# Altium project Firefly-Ultra.PrjPcb (part 2 of 2)

## Sheet ffultra_p2_channel.SchDoc
size A4; SheetNumber: 12; SheetTotal: 13
Used 2 times, as channels Pyro/CH1, Pyro/CH2. Parts and nets are listed once, with the designators drawn on the sheet.
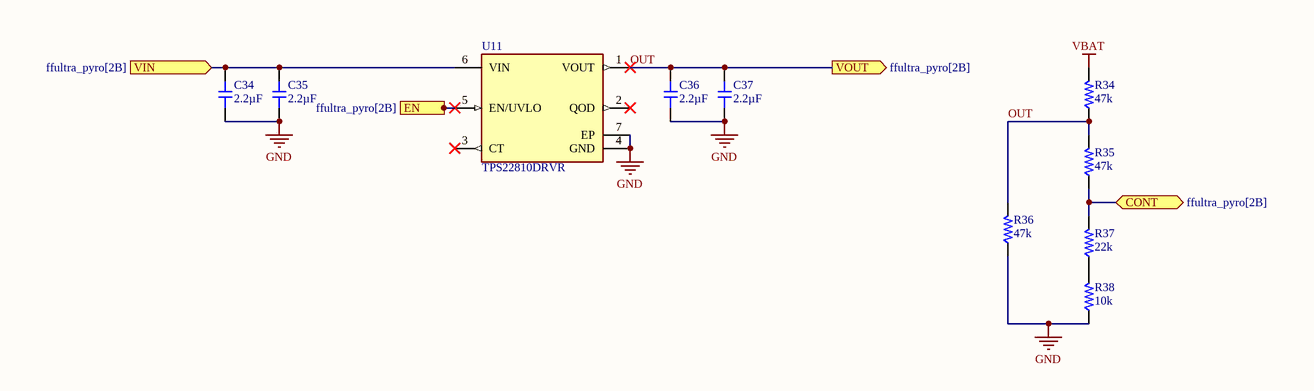
[diagram p10: ffultra_p2_channel.SchDoc]

### Parts
C34  value 2.2µF  [CAP-0402]  (hidden comment: CL05A225MQ5NSNC)
C35  value 2.2µF  [CAP-0402]  (hidden comment: CL05A225MQ5NSNC)
C36  value 2.2µF  [CAP-0402]  (hidden comment: CL05A105KA5NQNC)
C37  value 2.2µF  [CAP-0402]  (hidden comment: CL05A105KA5NQNC)
R34  value 47k  [RES-0402]  (hidden comment: 0402WGF4702TCE)
R35  value 47k  [RES-0402]  (hidden comment: 0402WGF4702TCE)
R36  value 47k  [RES-0402]  (hidden comment: 0402WGF4702TCE)
R37  value 22k  [RES-0402]  (hidden comment: 0402WGF2202TCE)
R38  value 10k  [RES-0402]  (hidden comment: 0402WGF1002TCE)
U11  TPS22810DRVR  [FP-DRV0006A-IPC_A]

### Ports
CONT (bidir, see ffultra_pyro[2B]), EN (in, see ffultra_pyro[2B]), VIN (in, see ffultra_pyro[2B]), VOUT (out, see ffultra_pyro[2B])

### Nets
GND: C34.1 C35.1 C36.1 C37.1 R36.1 R38.1 U11.4(GND) U11.7(EP)
VBAT: R34.2
CONT: R35.1 R37.2 ; port CONT
EN: U11.5(EN/UVLO) ; port EN
OUT: C36.2 C37.2 R34.1 R35.2 R36.2 U11.1(VOUT) ; port VOUT
VIN: C34.2 C35.2 U11.6(VIN) ; port VIN
NetR37_1: R37.1 R38.2

Not connected (* = marked no-connect by the designer): U11 2(QOD)* 3(CT)*

### Channels
Pyro/CH1: designators end in _CH1; ports CONT=CONT_CH1 EN=EN_CH1 VIN=Prechannel_Enabled VOUT=OUT
Pyro/CH2: designators end in _CH2; ports CONT=CONT_CH2 EN=EN_CH2 VIN=Prechannel_Enabled VOUT=OUT

### Library data of the parts
C34 C35 = CMP-001-00137-1: Capacitor, Ceramic (MLCC), 2.2uF, ±20%, 6.3V, X5R, ±20%, SMD 0402; Manufacturer: Samsung Electro-Mechanics; Voltage Rating: 6.3V; ComponentLink3Description: LCSC Part URL; JLCPCB Basic Part: Yes; JLCPCB Part Number: C12530; ComponentLink1URL: https://datasheet.lcsc.com/lcsc/1811021410_Samsung-Electro-Mechanics-CL05A225MQ5NSNC_C12530.pdf; Tolerance: 20%; Category: Capacitors - MLCC; Source: jlcpcb_capacitors_basic.schlib; ComponentLink2URL: https://jlcpcb.com/partdetail/C12530; ComponentLink3URL: https://lcsc.com/product-detail/Multilayer-Ceramic-Capacitors-MLCC---SMD-SMT_Samsung-Electro-Mechanics-Samsung-Electro-Mechanics-CL05A225MQ5NSNC_C12530.html; ComponentLink2Description: JLCPCB Part URL; Manufacturer Part Number: CL05A225MQ5NSNC; Temperature Coefficient: X5R; RoHS: Yes; ComponentLink1Description: Datasheet; Design Item ID: CL05A225MQ5NSNC; Case/Package: 0402
C36 C37 = CMP-001-00135-1: Capacitor, Ceramic (MLCC), 1uF, ±10%, 25V, X5R, ±10%, SMD 0402; Manufacturer: Samsung Electro-Mechanics; Voltage Rating: 25V; RoHS: Yes; Temperature Coefficient: X5R; Tolerance: 10%; Source: jlcpcb_capacitors_basic.schlib; ComponentLink1URL: https://datasheet.lcsc.com/lcsc/1811091611_Samsung-Electro-Mechanics-CL05A105KA5NQNC_C52923.pdf; JLCPCB Basic Part: Yes; ComponentLink1Description: Datasheet; ComponentLink2URL: https://jlcpcb.com/partdetail/C52923; Case/Package: 0402; ComponentLink3Description: LCSC Part URL; Manufacturer Part Number: CL05A105KA5NQNC; ComponentLink3URL: https://lcsc.com/product-detail/Multilayer-Ceramic-Capacitors-MLCC---SMD-SMT_Samsung-Electro-Mechanics-Samsung-Electro-Mechanics-CL05A105KA5NQNC_C52923.html; Design Item ID: CL05A105KA5NQNC; JLCPCB Part Number: C12530; ComponentLink2Description: JLCPCB Part URL; Category: Capacitors - MLCC
R34-R36 = CMP-009-00229-1: Resistor, 47kΩ, ±1%, 62.5mW, 50V, ±100ppm/℃, -55℃~+155℃, SMD 0402; Manufacturer: Uniroyal; Voltage Rating: 50V; ComponentLink2URL: https://jlcpcb.com/partdetail/C25792; ComponentLink1Description: Datasheet; Design Item ID: 0402WGF4702TCE; JLCPCB Part Number: C25792; Tolerance: 1%; Power Rating: 62.5mW; Temperature Coefficient: ±100ppm/℃; Temperature Rating: -55℃~+155℃; ComponentLink2Description: JLCPCB Part URL; Source: jlcpcb_resistors_basic.schlib; Case/Package: 0402; ComponentLink1URL: https://datasheet.lcsc.com/lcsc/2206010100_UNI-ROYAL-Uniroyal-Elec-0402WGF4702TCE_C25792.pdf; JLCPCB Basic Part: Yes; Manufacturer Part Number: 0402WGF4702TCE; Category: Resistors
R37 = CMP-009-00212-1: Resistor, 22kΩ, ±1%, 62.5mW, 50V, ±100ppm/℃, -55℃~+155℃, SMD 0402; Manufacturer: Uniroyal; Temperature Coefficient: ±100ppm/℃; Power Rating: 62.5mW; ComponentLink1URL: https://datasheet.lcsc.com/lcsc/2206010100_UNI-ROYAL-Uniroyal-Elec-0402WGF2202TCE_C25768.pdf; ComponentLink1Description: Datasheet; Manufacturer Part Number: 0402WGF2202TCE; Tolerance: 1%; Category: Resistors; Temperature Rating: -55℃~+155℃; Case/Package: 0402; Source: jlcpcb_resistors_basic.schlib; Voltage Rating: 50V; ComponentLink2Description: JLCPCB Part URL; ComponentLink2URL: https://jlcpcb.com/partdetail/C25768; Design Item ID: 0402WGF2202TCE; JLCPCB Basic Part: Yes; JLCPCB Part Number: C25768
R38 = CMP-009-00191-1: Resistor, 10kΩ, ±1%, 62.5mW, 50V, ±100ppm/℃, -55℃~+155℃, SMD 0402; Manufacturer: Uniroyal; Temperature Rating: -55℃~+155℃; ComponentLink1URL: https://datasheet.lcsc.com/lcsc/2206010100_UNI-ROYAL-Uniroyal-Elec-0402WGF1002TCE_C25744.pdf; Source: jlcpcb_resistors_basic.schlib; Tolerance: 1%; Design Item ID: 0402WGF1002TCE; ComponentLink1Description: Datasheet; ComponentLink2URL: https://jlcpcb.com/partdetail/C25744; Category: Resistors; JLCPCB Part Number: C25744; ComponentLink2Description: JLCPCB Part URL; Temperature Coefficient: ±100ppm/℃; JLCPCB Basic Part: Yes; Power Rating: 62.5mW; Case/Package: 0402; Voltage Rating: 50V; Manufacturer Part Number: 0402WGF1002TCE
U11 = CMP-019-00059-2: Buffer/Inverter Based Peripheral Driver, 1 Driver, PDSO6; Min Supply Voltage: 2.7V; Max Supply Voltage: 18V; RoHS Compliant: Yes; Height - Seated (Max): 0.8mm; Max Operating Temperature: 105°C; JLCPCB Part Number: C527679; Min Operating Temperature: -40°C; JESD-30 Code: S-PDSO-N6; Pins: 6; Case/Package: VSON

## Sheet ffultra_p2_pre-channel.SchDoc
size A4; SheetNumber: 11; SheetTotal: 12
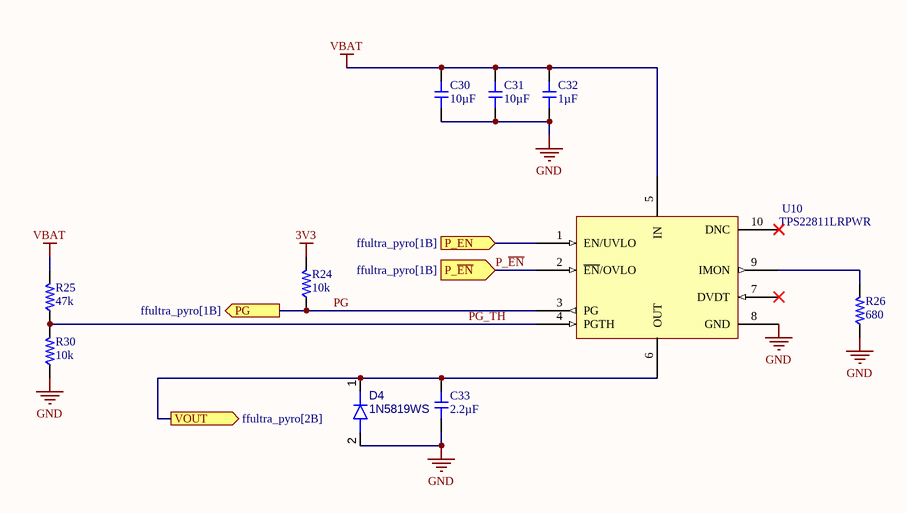
[diagram p11: ffultra_p2_pre-channel.SchDoc]

### Parts
C30  value 10µF  [CAP-0402]  (hidden comment: GRM155R61A106ME44D)
C31  value 10µF  [CAP-0402]  (hidden comment: GRM155R61A106ME44D)
C32  value 1µF  [CAP-0402]  (hidden comment: CL05A105KA5NQNC)
C33  value 2.2µF  [CAP-0402]  (hidden comment: CL05A225MQ5NSNC)
D4  1N5819WS  [FP-477-02-IPC_C]
R24  value 10k  [RES-0402]  (hidden comment: 0402WGF1002TCE)
R25  value 47k  [RES-0402]  (hidden comment: 0402WGF4702TCE)
R26  value 680  [RES-0402]  (hidden comment: 0402WGF6800TCE)
R30  value 10k  [RES-0402]  (hidden comment: 0402WGF1002TCE)
U10  TPS22811LRPWR  [TPS22811LRPWR-Footprint-1]

### Ports
P_EN (in, see ffultra_pyro[1B]), P_~{EN} (in, see ffultra_pyro[1B]), PG (out, see ffultra_pyro[1B]), VOUT (out, see ffultra_pyro[2B])

### Nets
3V3: R24.2
GND: C30.2 C31.2 C32.1 C33.1 D4.2(A) R26.1 R30.1 U10.8(GND)
VBAT: C30.1 C31.1 C32.2 R25.2 U10.5(IN)
MCU_EN: U10.1(EN/UVLO) ; port P_EN
P_~{EN}: U10.2(~{EN}/OVLO) ; port P_~{EN}
PG: R24.1 U10.3(PG) ; port PG
PG_TH: R25.1 R30.2 U10.4(PGTH)
Prechannel_Enabled: C33.2 D4.1(K) U10.6(OUT) ; port VOUT
NetR26_2: R26.2 U10.9(IMON)

Not connected (* = marked no-connect by the designer): U10 7(DVDT)* 10(DNC)*

### Library data of the parts
C30 C31 = CMP-001-01770-1: Capacitor, Ceramic (MLCC), 10uF, ±20%, 10V, X5R, ±20%, SMD 0402; Manufacturer: Murata Electronics; Manufacturer Part Number: GRM155R61A106ME44D; ComponentLink3URL: https://lcsc.com/product-detail/Multilayer-Ceramic-Capacitors-MLCC---SMD-SMT_Murata-Electronics-Murata-Electronics-GRM155R61A106ME44D_C77000.html; Case/Package: 0402; Category: Capacitors - MLCC; Design Item ID: GRM155R61A106ME44D; JLCPCB Part Number: C77000; Source: jlcpcb_capacitors_extended_0402.schlib; ComponentLink2URL: https://jlcpcb.com/partdetail/C77000; Temperature Coefficient: X5R; ComponentLink3Description: LCSC Part URL; Tolerance: 20%; RoHS: Yes; JLCPCB Basic Part: No; ComponentLink2Description: JLCPCB Part URL; Voltage Rating: 10V; ComponentLink1Description: Datasheet; ComponentLink1URL: https://datasheet.lcsc.com/lcsc/1811141510_Murata-Electronics-GRM155R61A106ME44D_C77000.pdf
C32 = CMP-001-00135-1: as C36 on sheet ffultra_p2_channel; Voltage Rating: 25V; RoHS: Yes; Temperature Coefficient: X5R; Tolerance: 10%; Source: jlcpcb_capacitors_basic.schlib; ComponentLink1URL: https://datasheet.lcsc.com/lcsc/1811091611_Samsung-Electro-Mechanics-CL05A105KA5NQNC_C52923.pdf; JLCPCB Basic Part: Yes; ComponentLink1Description: Datasheet; ComponentLink2URL: https://jlcpcb.com/partdetail/C52923; Case/Package: 0402; ComponentLink3Description: LCSC Part URL; Manufacturer Part Number: CL05A105KA5NQNC; ComponentLink3URL: https://lcsc.com/product-detail/Multilayer-Ceramic-Capacitors-MLCC---SMD-SMT_Samsung-Electro-Mechanics-Samsung-Electro-Mechanics-CL05A105KA5NQNC_C52923.html; Design Item ID: CL05A105KA5NQNC; JLCPCB Part Number: C52923; ComponentLink2Description: JLCPCB Part URL; Category: Capacitors - MLCC
C33 = CMP-001-00137-1: as C34 on sheet ffultra_p2_channel; Voltage Rating: 6.3V; ComponentLink3Description: LCSC Part URL; JLCPCB Basic Part: Yes; JLCPCB Part Number: C12530; ComponentLink1URL: https://datasheet.lcsc.com/lcsc/1811021410_Samsung-Electro-Mechanics-CL05A225MQ5NSNC_C12530.pdf; Tolerance: 20%; Category: Capacitors - MLCC; Source: jlcpcb_capacitors_basic.schlib; ComponentLink2URL: https://jlcpcb.com/partdetail/C12530; ComponentLink3URL: https://lcsc.com/product-detail/Multilayer-Ceramic-Capacitors-MLCC---SMD-SMT_Samsung-Electro-Mechanics-Samsung-Electro-Mechanics-CL05A225MQ5NSNC_C12530.html; ComponentLink2Description: JLCPCB Part URL; Manufacturer Part Number: CL05A225MQ5NSNC; Temperature Coefficient: X5R; RoHS: Yes; ComponentLink1Description: Datasheet; Design Item ID: CL05A225MQ5NSNC; Case/Package: 0402
D4 = CMP-004-00036-1: 40V 600mV@1A 1A SOD-323  Schottky Barrier Diodes (SBD) ROHS; JLCPCB Part Number: C191023
R24 R30 = CMP-009-00191-1: as R38 on sheet ffultra_p2_channel; Temperature Rating: -55℃~+155℃; ComponentLink1URL: https://datasheet.lcsc.com/lcsc/2206010100_UNI-ROYAL-Uniroyal-Elec-0402WGF1002TCE_C25744.pdf; Source: jlcpcb_resistors_basic.schlib; Tolerance: 1%; Design Item ID: 0402WGF1002TCE; ComponentLink1Description: Datasheet; ComponentLink2URL: https://jlcpcb.com/partdetail/C25744; Category: Resistors; JLCPCB Part Number: C25744; ComponentLink2Description: JLCPCB Part URL; Temperature Coefficient: ±100ppm/℃; JLCPCB Basic Part: Yes; Power Rating: 62.5mW; Case/Package: 0402; Voltage Rating: 50V; Manufacturer Part Number: 0402WGF1002TCE
R25 = CMP-009-00229-1: as R34 on sheet ffultra_p2_channel; Voltage Rating: 50V; ComponentLink2URL: https://jlcpcb.com/partdetail/C25792; ComponentLink1Description: Datasheet; Design Item ID: 0402WGF4702TCE; JLCPCB Part Number: C25792; Tolerance: 1%; Power Rating: 62.5mW; Temperature Coefficient: ±100ppm/℃; Temperature Rating: -55℃~+155℃; ComponentLink2Description: JLCPCB Part URL; Source: jlcpcb_resistors_basic.schlib; Case/Package: 0402; ComponentLink1URL: https://datasheet.lcsc.com/lcsc/2206010100_UNI-ROYAL-Uniroyal-Elec-0402WGF4702TCE_C25792.pdf; JLCPCB Basic Part: Yes; Manufacturer Part Number: 0402WGF4702TCE; Category: Resistors
R26 = CMP-009-00241-1: Resistor, 680Ω, ±1%, 62.5mW, 50V, ±100ppm/℃, -55℃~+155℃, SMD 0402; Manufacturer: Uniroyal; ComponentLink1Description: Datasheet; ComponentLink1URL: https://datasheet.lcsc.com/lcsc/2205311900_UNI-ROYAL-Uniroyal-Elec-0402WGF6800TCE_C25130.pdf; Temperature Rating: -55℃~+155℃; Category: Resistors; Source: jlcpcb_resistors_basic.schlib; Power Rating: 62.5mW; JLCPCB Part Number: C25130; Voltage Rating: 50V; ComponentLink2Description: JLCPCB Part URL; Tolerance: 1%; Manufacturer Part Number: 0402WGF6800TCE; Temperature Coefficient: ±100ppm/℃; JLCPCB Basic Part: Yes; Case/Package: 0402; Design Item ID: 0402WGF6800TCE; ComponentLink2URL: https://jlcpcb.com/partdetail/C25130
U10 = CMP-019-00060-6: 2.7-V to 16-V, 10-A, 6-mΩ load switch with fast overvoltage protection and current monitoring 10-VQFN-HR -40 to 125; JLCPCB Part Number: C17294173

## Sheet ffultra_human-interfaces.SchDoc
size A4; SheetNumber: 13; SheetTotal: 13
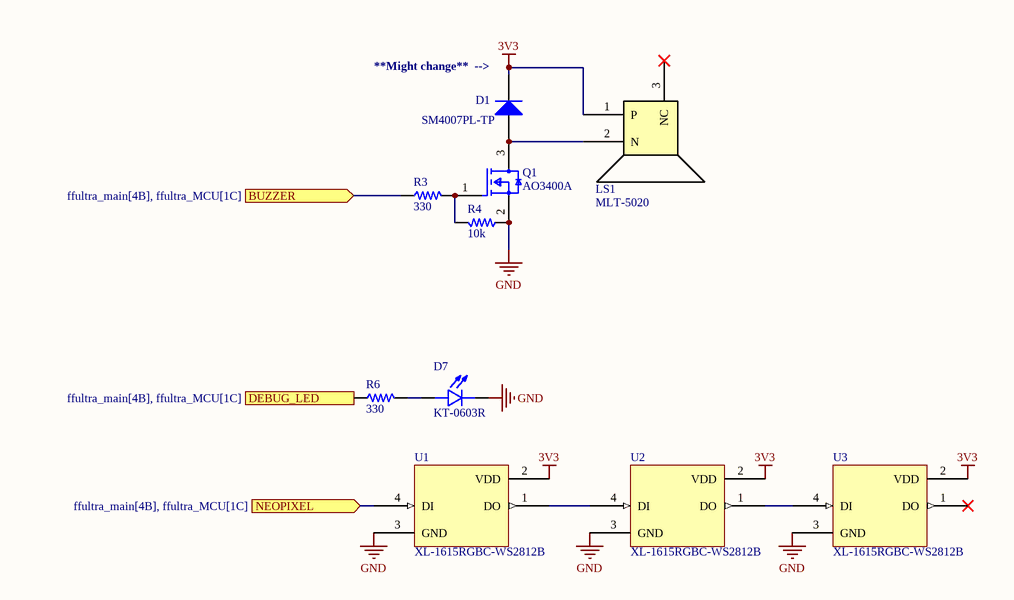
[diagram p12: ffultra_human-interfaces.SchDoc]

### Parts
D1  SM4007PL-TP  [MCC-SOD-123FL_V]
D7  KT-0603R  [LED_KT-0603R]
LS1  MLT-5020  [MLT-5020]
Q1  AO3400A  [FP-SOT23-IPC_C]
R3  value 330  [RES-0402]  (hidden comment: 0402WGF3300TCE)
R4  value 10k  [RES-0402]  (hidden comment: 0402WGF1002TCE)
R6  value 330  [RES-0402]  (hidden comment: 0402WGF3300TCE)
U1  XL-1615RGBC-WS2812B  [XL-1615RGBC-WS2812B-Footprint-1]
U2  XL-1615RGBC-WS2812B  [XL-1615RGBC-WS2812B-Footprint-1]
U3  XL-1615RGBC-WS2812B  [XL-1615RGBC-WS2812B-Footprint-1]

### Ports
BUZZER (in, see ffultra_main[4B], ffultra_MCU[1C]), DEBUG_LED (in, see ffultra_main[4B], ffultra_MCU[1C]), NEOPIXEL (in, see ffultra_main[4B], ffultra_MCU[1C])

### Nets
3V3: D1.2(K) LS1.1(P) U1.2(VDD) U2.2(VDD) U3.2(VDD)
GND: D7.C Q1.2(S) R4.1 U1.3(GND) U2.3(GND) U3.3(GND)
BUZZ: R3.1 ; port BUZZER
DEBUG_LED: R6.1 ; port DEBUG_LED
SPI3_MOSI: U1.4(DI) ; port NEOPIXEL
NetD1_1: D1.1(A) LS1.2(N) Q1.3(D)
NetD7_A: D7.A R6.2
NetQ1_1: Q1.1(G) R3.2 R4.2
NetU1_1: U1.1(DO) U2.4(DI)
NetU2_1: U2.1(DO) U3.4(DI)

Not connected (* = marked no-connect by the designer): LS1 3(NC)*; U3 1(DO)*

### Notes on the sheet
- (near D1) **Might change**  -->

### Library data of the parts
D1 = CMP-004-00034-1: DIODE GEN PURP 1KV 1A SOD123FL; LCSC Part #: C64898; JLCPCB Part Number: C64898
D7 = CMP-004-00035-2: Red 0603 Light Emitting Diodes; MF: Hubei KENTO Elec; Value: *; Pins: 2; Design Item ID: KT-0603R; MP: KT-0603R; Case/Package: Package; Component Type: Standard; Check_prices: https://www.snapeda.com/parts/KT-0603R/Hubei+KENTO+Elec/view-part/?ref=eda; SnapEDA_Link: https://www.snapeda.com/parts/KT-0603R/Hubei+KENTO+Elec/view-part/?ref=snap; JLCPCB Part Number: C2286; Source: KT-0603R.SchLib
LS1 = CMP-00027-00002-1: Externally Driven Magnetic 4000Hz SMD,5x5mm  Buzzers ROHS; JLCPCB Part Number: C94598
Q1 = CMP-013-00038-1: N沟道 VDS=30V VGS=±12V ID=5.7A P=1.4W; LCSC Part #: C20917; JLCPCB Part Number: C20917
R3 R6 = CMP-009-00220-1: Resistor, 330Ω, ±1%, 62.5mW, 50V, ±100ppm/℃, -55℃~+155℃, SMD 0402; Manufacturer: Uniroyal; ComponentLink1Description: Datasheet; Category: Resistors; Temperature Rating: -55℃~+155℃; Temperature Coefficient: ±100ppm/℃; Tolerance: 1%; ComponentLink1URL: https://datasheet.lcsc.com/lcsc/2205311900_UNI-ROYAL-Uniroyal-Elec-0402WGF3300TCE_C25104.pdf; Design Item ID: 0402WGF3300TCE; JLCPCB Part Number: C25104; ComponentLink2URL: https://jlcpcb.com/partdetail/C25104; Manufacturer Part Number: 0402WGF3300TCE; Case/Package: 0402; JLCPCB Basic Part: Yes; ComponentLink2Description: JLCPCB Part URL; Source: jlcpcb_resistors_basic.schlib; Power Rating: 62.5mW; Voltage Rating: 50V
R4 = CMP-009-00191-1: as R38 on sheet ffultra_p2_channel; Temperature Rating: -55℃~+155℃; ComponentLink1URL: https://datasheet.lcsc.com/lcsc/2206010100_UNI-ROYAL-Uniroyal-Elec-0402WGF1002TCE_C25744.pdf; Source: jlcpcb_resistors_basic.schlib; Tolerance: 1%; Design Item ID: 0402WGF1002TCE; ComponentLink1Description: Datasheet; ComponentLink2URL: https://jlcpcb.com/partdetail/C25744; Category: Resistors; JLCPCB Part Number: C25744; ComponentLink2Description: JLCPCB Part URL; Temperature Coefficient: ±100ppm/℃; JLCPCB Basic Part: Yes; Power Rating: 62.5mW; Case/Package: 0402; Voltage Rating: 50V; Manufacturer Part Number: 0402WGF1002TCE
U1-U3 = CMP-007-00038-2: 1615 RGB LEDs(Built-in IC) ROHS; JLCPCB Part Number: C5349954

## Nets that join several sheets
3V3: ffultra_IMU (13 pins), ffultra_pressure (C29.1 U9.1 U9.2), ffultra_wireless (8 pins), ffultra_connectors (J3.3 J4.7 J4.10), ffultra_MCU (19 pins), ffultra_power (B2.2 B2.4 C19.2 R14.2), ffultra_storage (C21.2 R15.2 U5.8), ffultra_p2_pre-channel (R24.2), ffultra_human-interfaces (5 pins)
GND: ffultra_IMU (17 pins), ffultra_pressure (C29.2 U9.3 U9.4 U9.5), ffultra_wireless (22 pins), ffultra_connectors (11 pins), ffultra_MCU (25 pins), ffultra_power (5 pins), ffultra_storage (C21.1 U5.4), ffultra_pyro (R22.1 R23.1), Pyro/CH1 (8 pins), Pyro/CH2 (8 pins), ffultra_p2_pre-channel (8 pins), ffultra_human-interfaces (6 pins)
VBACKUP: ffultra_wireless (C38.1 M2.2 MD1.6), ffultra_MCU (B1.1)
VBAT: ffultra_connectors (J4.8 J4.9), ffultra_power (B2.3 C20.2 Q3.2 RT2.2), Pyro/CH1 (R34_CH1.2), Pyro/CH2 (R34_CH2.2), ffultra_p2_pre-channel (5 pins)
BAT+: ffultra_connectors (J3.2), ffultra_power (RT1.1)
BOOT0: ffultra_wireless (R7.2), ffultra_MCU (B1.60 R2.2 SW1.2 SW1.2')
BUZZ: ffultra_MCU (B1.9), ffultra_human-interfaces (R3.1)
CONT_CH1: ffultra_MCU (B1.20), Pyro/CH1 (R35_CH1.1 R37_CH1.2)
CONT_CH2: ffultra_MCU (B1.26), Pyro/CH2 (R35_CH2.1 R37_CH2.2)
DEBUG_LED: ffultra_MCU (B1.2), ffultra_human-interfaces (R6.1)
EN_CH1: ffultra_MCU (B1.36), Pyro/CH1 (U11_CH1.5)
EN_CH2: ffultra_MCU (B1.37), Pyro/CH2 (U11_CH2.5)
Flash CLK: ffultra_MCU (B1.27), ffultra_storage (U5.6)
Flash IO 0: ffultra_MCU (B1.22), ffultra_storage (U5.5)
Flash IO 1: ffultra_MCU (B1.23), ffultra_storage (U5.2)
Flash IO 2: ffultra_MCU (B1.24), ffultra_storage (U5.3)
Flash IO 3: ffultra_MCU (B1.25), ffultra_storage (U5.7)
Flash NCS: ffultra_MCU (B1.52), ffultra_storage (R15.1 U5.1)
GPS_PPS: ffultra_wireless (MD1.4), ffultra_MCU (B1.39)
GPS_PRG: ffultra_wireless (MD1.18), ffultra_MCU (B1.35)
GPS_RX: ffultra_wireless (MD1.3), ffultra_MCU (B1.42)
GPS_TX: ffultra_wireless (MD1.2), ffultra_MCU (B1.43)
GPS_WAKE: ffultra_wireless (MD1.5), ffultra_MCU (B1.38)
HRLP_~{CS}: ffultra_IMU (U7.8), ffultra_MCU (B1.28)
HRLP_INT: ffultra_IMU (U7.11), ffultra_MCU (B1.14)
I2C1_SCL: ffultra_IMU (U8.A3), ffultra_MCU (B1.58 R16.1)
I2C1_SDA: ffultra_IMU (U8.B4), ffultra_MCU (B1.59 R17.1)
I2C3_SCL: ffultra_pressure (U9.8), ffultra_MCU (B1.41 R5.1)
I2C3_SDA: ffultra_pressure (U9.7), ffultra_MCU (B1.40 R12.1)
LRHP_INT: ffultra_IMU (U6.4), ffultra_MCU (B1.51)
LRHP_NSS: ffultra_IMU (U6.12), ffultra_MCU (B1.33)
MCU_EN: ffultra_MCU (B1.15), ffultra_pyro (R22.2), ffultra_p2_pre-channel (U10.1)
OB_SPI_MISO: ffultra_IMU (U6.1 U7.7), ffultra_MCU (B1.56)
OB_SPI_MOSI: ffultra_IMU (U6.14 U7.6), ffultra_MCU (B1.57)
OB_SPI_SCK: ffultra_IMU (U6.13 U7.4), ffultra_MCU (B1.21)
OFB_SPI_MISO: ffultra_wireless (U4.2), ffultra_connectors (J4.5), ffultra_MCU (B1.10)
OFB_SPI_MOSI: ffultra_wireless (U4.3), ffultra_connectors (J4.3), ffultra_MCU (B1.11)
OFB_SPI_SCK: ffultra_wireless (U4.4), ffultra_connectors (J4.4), ffultra_MCU (B1.34)
OUT: ffultra_connectors (J3.5), Pyro/CH1 (6 pins)
OUT: ffultra_connectors (J3.7), Pyro/CH2 (6 pins)
P_~{EN}: ffultra_connectors (J3.4), ffultra_pyro (R23.2), ffultra_p2_pre-channel (U10.2)
Prechannel_Enabled: Pyro/CH1 (C34_CH1.2 C35_CH1.2 U11_CH1.6), Pyro/CH2 (C34_CH2.2 C35_CH2.2 U11_CH2.6), ffultra_p2_pre-channel (C33.2 D4.1 U10.6)
RD_BUSY: ffultra_wireless (U4.16), ffultra_MCU (B1.54)
RD_DIO1: ffultra_wireless (U4.15), ffultra_MCU (B1.50)
RD_NSS: ffultra_wireless (U4.5), ffultra_MCU (B1.8)
RD_RESET: ffultra_wireless (U4.6), ffultra_MCU (B1.61)
SPI3_MOSI: ffultra_MCU (B1.53), ffultra_human-interfaces (U1.4)
USB_DATA_N: ffultra_connectors (J2.A7 J2.B7), ffultra_MCU (B1.44)
USB_DATA_P: ffultra_connectors (J2.A6 J2.B6), ffultra_MCU (B1.45)
USB_VBUS: ffultra_connectors (J2.A4-B9 J2.B4-A9), ffultra_power (D5.1)